# Altium schematic sheet Power-Sheet-1.SchDoc (part 3 of 3)
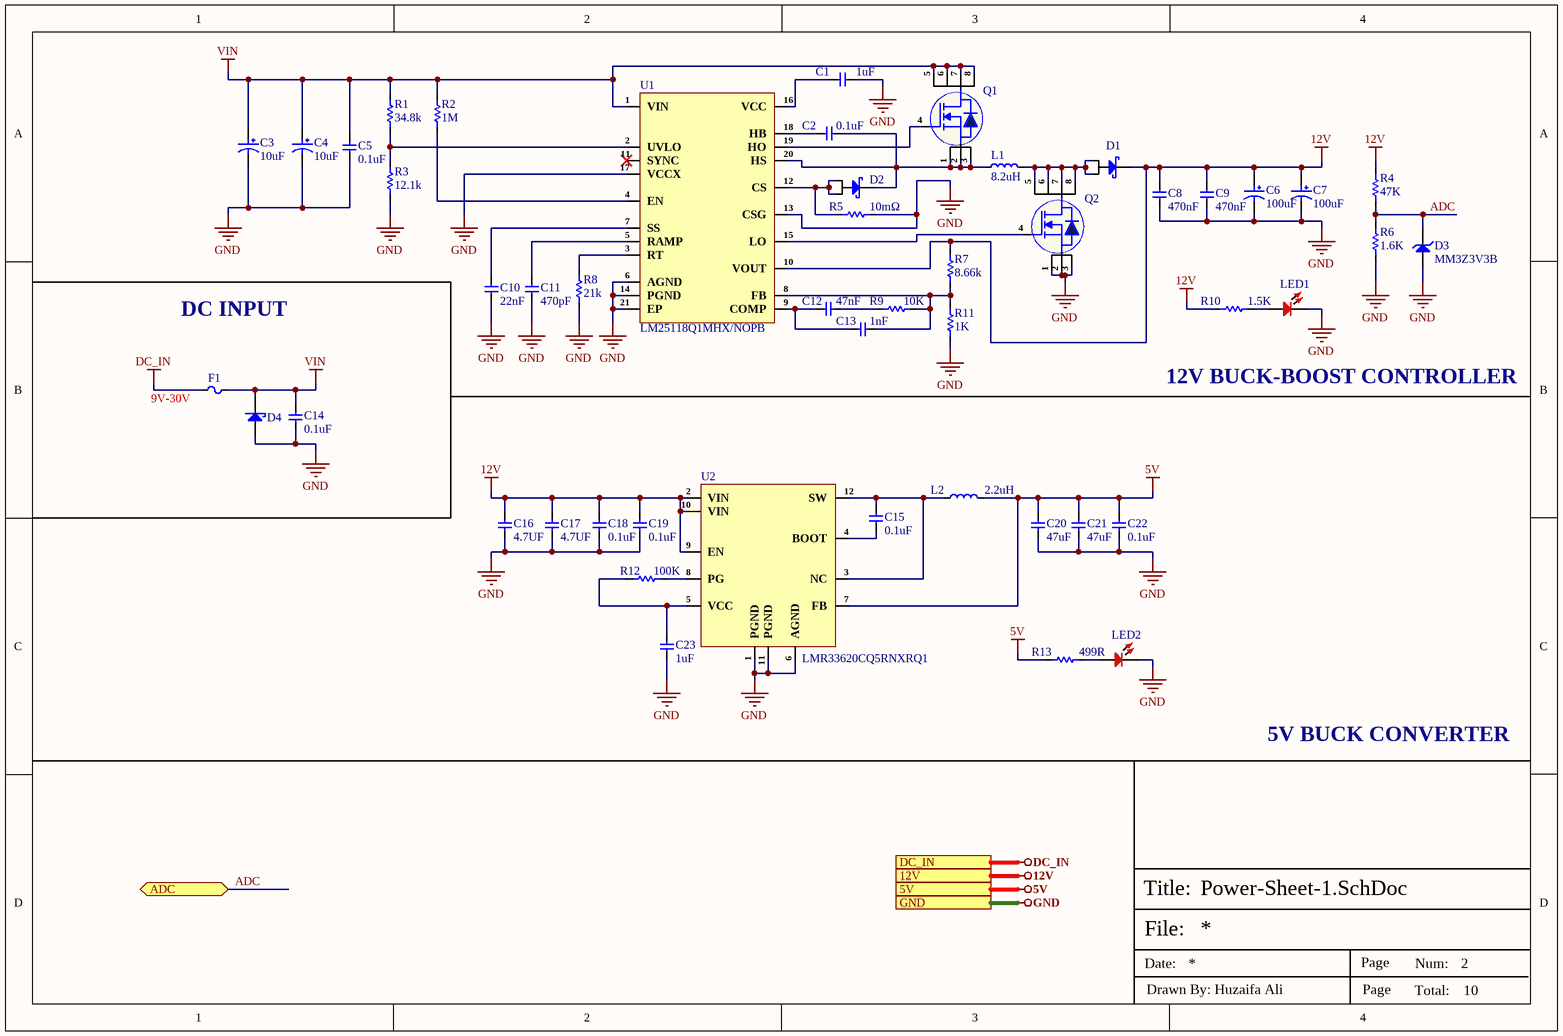
[diagram p2: Power-Sheet-1.SchDoc]

## Library data of the parts (continued)
U2 = LMR33620CQ5RNXRQ1: IC REG BUCK 5V 2A 12VQFN; Manufacturer: Texas Instruments; Supplier: Digikey; Supplier Part Number: 296-53213-1-ND; Manufacturer Part Number: LMR33620CQ5RNXRQ1; RoHS: Yes; Category: Voltage Regulators - Switching; Stock: 5909; Pricing: 1=2.41, 10=2.163, 25=2.04, 100=1.7383, 250=1.63216, 500=1.42814, 1000=1.18332 (USD); ComponentLink1URL: http://www.ti.com/general/docs/suppproductinfo.tsp?distId=10&amp;gotoUrl=http%3A%2F%2Fwww.ti.com%2Flit%2Fgpn%2Flmr33620-q1&src-supplier=Digikey; ComponentLink1Description: http://www.ti.com/general/docs/suppproductinfo.tsp?distId=10&amp;gotoUrl=http%3A%2F%2Fwww.ti.com%2Flit%2Fgpn%2Flmr33620-q1&src-supplier=Digikey; Item Type: IC